# Altium schematic sheet Peripheral_Section.SchDoc
size A4; DocumentNumber: 6; SheetNumber: 6; SheetTotal: 7
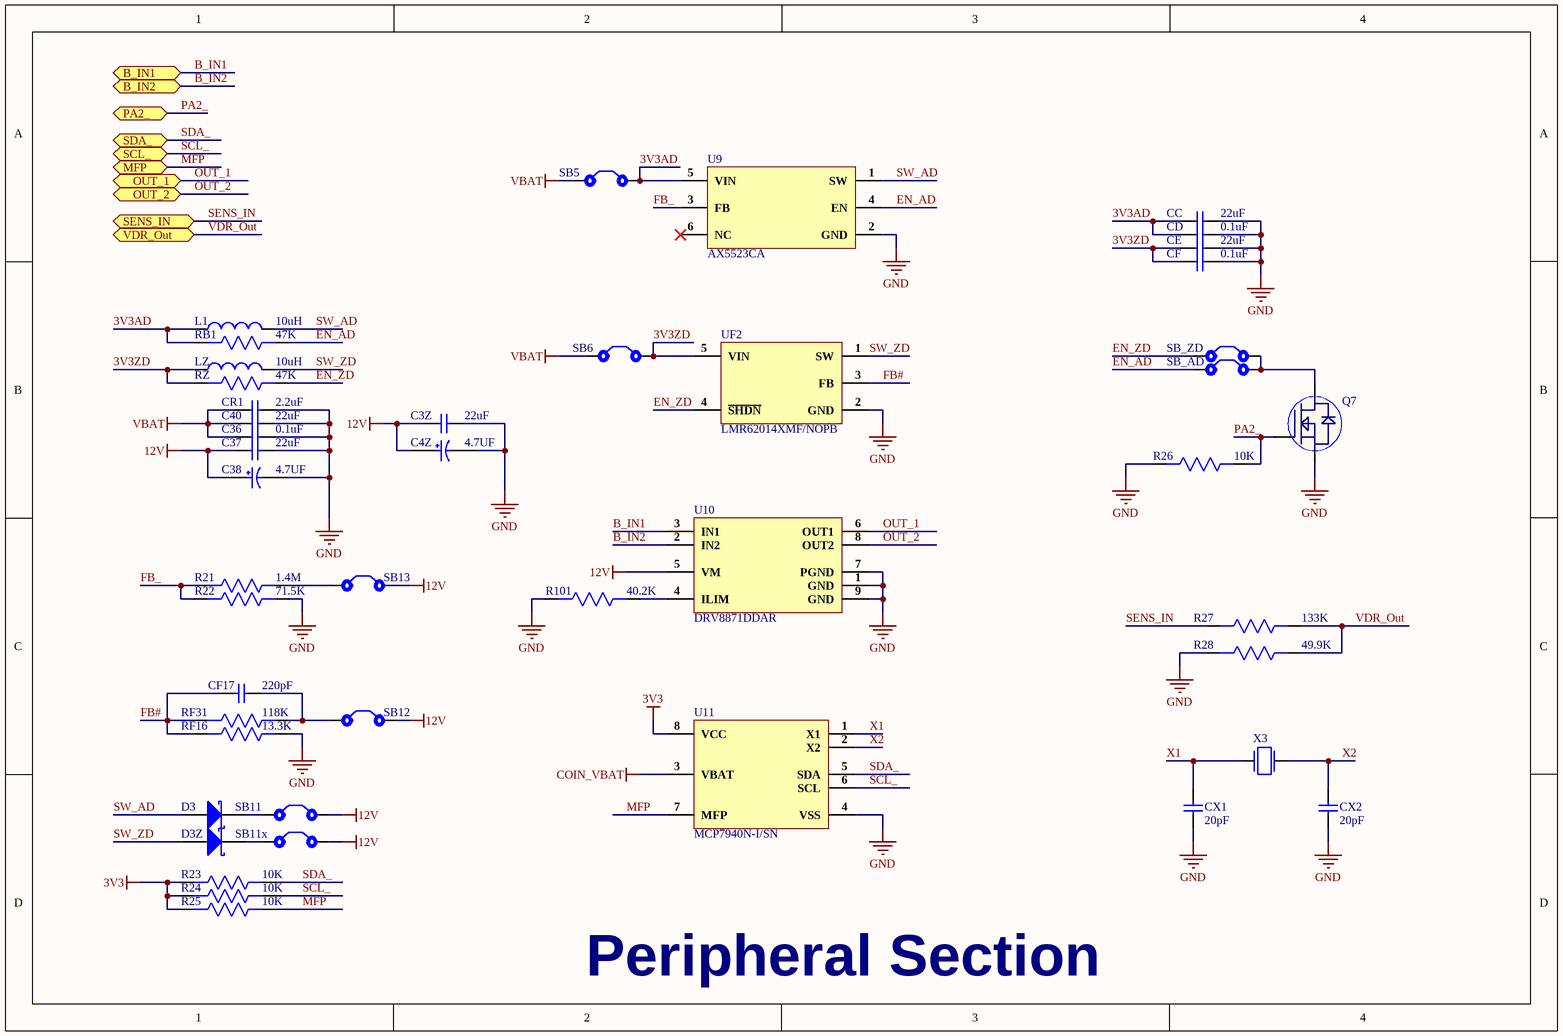
[diagram p0: Peripheral_Section.SchDoc]

## Parts
C3Z  22uF  [Cap0805]
C4Z  4.7UF  [TAJB475K035RNJ]
C36  0.1uF  [Cap0402]
C37  22uF  [Cap0805]
C38  4.7UF  [TAJB475K035RNJ]
C40  22uF  [Cap0805]
CC  22uF  [Cap0805]
CD  0.1uF  [Cap0402]
CE  22uF  [Cap0805]
CF  0.1uF  [Cap0402]
CF17  220pF  [Cap0402]
CR1  2.2uF  [Cap0402]
CX1  20pF  [Cap 0201]
CX2  20pF  [Cap 0201]
D3  PMEG3010ER,115  [SOD123W]  (value not drawn)
D3Z  PMEG3010ER,115  [SOD123W]  (value not drawn)
L1  value 10uH  [MS0420-100M]  (hidden comment: MS0420-100M)
LZ  value 10uH  [MS0420-100M]  (hidden comment: MS0420-100M)
Q7  ZVN3310FTA  [SOT23-3]  (value not drawn)
R21  1.4M  [Res0603]
R22  71.5K  [Res0402]
R23  10K  [Res0402]
R24  10K  [Res0402]
R25  10K  [Res0402]
R26  10K  [Res0402]
R27  133K  [Res0402]
R28  49.9K  [Res0402]
R101  40.2K  [Res0402]
RB1  47K  [Res0402]
RF16  13.3K  [Res0402]
RF31  118K  [Res0402]
RZ  47K  [Res0402]
SB5  Solder Bridge  [Solder Bridge]  (value not drawn)
SB6  Solder Bridge  [Solder Bridge]  (value not drawn)
SB11  Solder Bridge  [Solder Bridge]  (value not drawn)
SB11x  Solder Bridge  [Solder Bridge]  (value not drawn)
SB12  Solder Bridge  [Solder Bridge]  (value not drawn)
SB13  Solder Bridge  [Solder Bridge]  (value not drawn)
SB_AD  Solder Bridge  [Solder Bridge]  (value not drawn)
SB_ZD  Solder Bridge  [Solder Bridge]  (value not drawn)
U9  AX5523CA  [SOT-23-6]
U10  DRV8871DDAR  [DRV8871DDAR]
U11  MCP7940N-I/SN  [MCP7940N-I/SN]
UF2  LMR62014XMF/NOPB  [SOT23-5]
X3  NX3215SA-32.768K-STD-MUA-8  [2-SMD, No Lead]  (value not drawn)

## Ports
B_IN1 (bidir), B_IN2 (bidir), MFP (bidir), OUT_1 (bidir), OUT_2 (bidir), PA2_ (bidir), SCL_ (bidir), SDA_ (bidir), SENS_IN (bidir), VDR_Out (bidir)

## Nets
3V3: R23.2 R24.2 R25.2 U11.8(VCC)
12V: C3Z.1 C4Z.2 C37.1 C38.2 SB11.2 SB11x.2 SB12.2 SB13.2 U10.5(VM)
COIN_VBAT: U11.3(VBAT)
GND: C3Z.2 C4Z.1 C36.2 C37.2 C38.1 C40.2 CC.2 CD.2 CE.2 CF.2 CR1.2 CX1.1 CX2.1 Q7.2(S) R22.1 R26.2 R28.2 R101.2 RF16.1 U9.2(GND) U10.1(GND) U10.7(PGND) U10.9(GND) U11.4(VSS) UF2.2(GND)
VBAT: C36.1 C40.1 CR1.1 SB5.1 SB6.1
3V3AD: CC.1 CD.1 L1.1 RB1.2 SB5.2 U9.5(VIN)
3V3ZD: CE.1 CF.1 LZ.1 RZ.2 SB6.2 UF2.5(VIN)
B_IN1: U10.3(IN1) ; port B_IN1
B_IN2: U10.2(IN2) ; port B_IN2
EN_AD: RB1.1 SB_AD.1 U9.4(EN)
EN_ZD: RZ.1 SB_ZD.1 UF2.4(~{SHDN})
FB#: CF17.1 RF16.2 RF31.2 UF2.3(FB)
FB_: R21.2 R22.2 U9.3(FB)
MFP: R25.1 U11.7(MFP) ; port MFP
OUT_1: U10.6(OUT1) ; port OUT_1
OUT_2: U10.8(OUT2) ; port OUT_2
PA2_: Q7.1(G) R26.1 ; port PA2_
SCL_: R24.1 U11.6(SCL) ; port SCL_
SDA_: R23.1 U11.5(SDA) ; port SDA_
SENS_IN: R27.2 ; port SENS_IN
SW_AD: D3.A L1.2 U9.1(SW)
SW_ZD: D3Z.A LZ.2 UF2.1(SW)
VDR_Out: R27.1 R28.1 ; port VDR_Out
X1: CX1.2 U11.1(X1) X3.2
X2: CX2.2 U11.2(X2) X3.1
NetCF17_2: CF17.2 RF31.1 SB12.1
NetD3_K: D3.K SB11.1
NetD3Z_K: D3Z.K SB11x.1
NetQ7_3: Q7.3(D) SB_AD.2 SB_ZD.2
NetR21_1: R21.1 SB13.1
NetR101_1: R101.1 U10.4(ILIM)

Not connected (* = marked no-connect by the designer): U9 6(NC)*

## Notes on the sheet
- Peripheral Section

## Library data of the parts
C3Z C37 C40 = GRM21BR61E226ME44L: CAP CER 22UF 25V X5R 0805; Manufacturer: Murata; Material: Ceramic; Tolerance: 20%; Supplier 1: Digi-Key; Manufacturer Part Number: GRM21BR61E226ME44L; Stock 1: 469852; Pricing 1: 1=0.54, 10=0.383, 100=0.2521, 500=0.18672, 1000=0.15871 (USD); Mount: Surface Mount; Case/Package: 0805; Weight: 0.000335oz; Case Code (Metric): 2012; Case Code (Imperial): 0805; Min Operating Temperature: -55°C; Max Operating Temperature: 85°C; Capacitance: 22uF; Voltage Rating: 25V; Packaging: Tape and Reel; Dielectric: X5R; Voltage: 25V; Termination: SMD/SMT; Composition: Ceramic; Voltage Rating (DC): 25V; Package Quantity: 3000; Length: 2mm; Height: 1.25mm; Width: 1.25mm; Thickness: 0.057inch; Depth: 1.25mm; REACH SVHC: No SVHC; Lead Free: Lead Free; ComponentLink1URL: http://www.farnell.com/datasheets/2048737.pdf?src-supplier=Farnell; ComponentLink1Description: http://www.farnell.com/datasheets/2048737.pdf?src-supplier=Farnell; ComponentLink2URL: http://www.farnell.com/datasheets/2048737.pdf?src-supplier=Element14; ComponentLink2Description: http://www.farnell.com/datasheets/2048737.pdf?src-supplier=Element14; Supplier Part Number 1: 490-10749-1-ND
C4Z C38 = TAJB475K035RNJ: CAP TANT 4.7UF 10% 35V 1411; Manufacturer: Kyocera AVX; Dielectric Material: Tantalum; Tolerance: 20%; ESR (Equivalent Series Resistance): 3.1R; Leakage Current: 1.6uA; Polarity: Polar; Dissipation Factor: 6%; Supplier 1: Digi-Key; Manufacturer Part Number: TAJB475K035RNJ; Stock 1: 3949; Pricing 1: 1=0.71, 10=0.505, 100=0.3322, 500=0.2461, 1000=0.20919 (USD); Mount: Surface Mount,PCB; Case/Package: 1210; Number of Pins: 2; Weight: 0.000564oz; Case Code (Imperial): 1210; Case Code (Metric): 3528; Min Operating Temperature: -55°C; Max Operating Temperature: 125°C; Capacitance: 4.7uF; Voltage Rating: 35V; Packaging: Tape and Reel; Package Quantity: 1; Voltage Rating (DC): 35V; Termination: SMD/SMT; Voltage: 35V; Features: General Purpose; Length: 3.5mm; Height: 1.9mm; Depth: 2.8mm; Width: 2.8mm; Height - Seated (Max): 0.083inch; Radiation Hardening: No; REACH SVHC: No SVHC; Lead Free: Lead Free; ComponentLink1URL: http://uk.rs-online.com/webdocs/0ccd/0900766b80ccdc61.pdf?src-supplier=RSComponents; ComponentLink1Description: http://uk.rs-online.com/webdocs/0ccd/0900766b80ccdc61.pdf?src-supplier=RSComponents; ComponentLink2URL: http://www.farnell.com/datasheets/1826076.pdf?src-supplier=Element14; ComponentLink2Description: http://www.farnell.com/datasheets/1826076.pdf?src-supplier=Element14; ComponentLink3URL: http://datasheets.avx.com/TAJ.pdf?src-supplier=Digi-Key; ComponentLink3Description: http://datasheets.avx.com/TAJ.pdf?src-supplier=Digi-Key; ComponentLink4URL: http://www.avx.com/docs/Catalogs/taj.pdf?src-supplier=Farnell; ComponentLink4Description: http://www.avx.com/docs/Catalogs/taj.pdf?src-supplier=Farnell; ComponentLink5URL: https://www.alliedelec.com/m/d/9166fb755e7ffffad4c533f86d810ce4.pdf?src-supplier=Allied+Electronics; ComponentLink5Description: https://www.alliedelec.com/m/d/9166fb755e7ffffad4c533f86d810ce4.pdf?src-supplier=Allied+Electronics; ComponentLink6URL: https://www.distrelec.biz/Web/Downloads/_e/ng/taj_ENG.pdf?mime=application%2Fpdf&src-supplier=Distrelec; ComponentLink6Description: https://www.distrelec.biz/Web/Downloads/_e/ng/taj_ENG.pdf?mime=application%2Fpdf&src-supplier=Distrelec; ComponentLink7URL: http://www.avx.com/docs/catalogs/taj.pdf?src-supplier=Avnet+Europe; ComponentLink7Description: http://www.avx.com/docs/catalogs/taj.pdf?src-supplier=Avnet+Europe; ComponentLink8URL: http://www.avx.com/docs/catalogs/taj.pdf?src-supplier=Avnet; ComponentLink8Description: http://www.avx.com/docs/catalogs/taj.pdf?src-supplier=Avnet; ComponentLink9URL: http://www.avxcorp.com/docs/Catalogs/taj.pdf?src-supplier=Future+Electronics; ComponentLink9Description: http://www.avxcorp.com/docs/Catalogs/taj.pdf?src-supplier=Future+Electronics; ComponentLink10URL: http://www.mouser.com/ds/2/40/taj-776811.pdf?src-supplier=Mouser; ComponentLink10Description: http://www.mouser.com/ds/2/40/taj-776811.pdf?src-supplier=Mouser; ComponentLink11URL: https://www.verical.com/server-webapp/html/getDatasheet?partID=149140&src-supplier=Verical; ComponentLink11Description: https://www.verical.com/server-webapp/html/getDatasheet?partID=149140&src-supplier=Verical; Supplier Part Number 1: 478-1691-1-ND
C36 CD CF = CC0402KRX7R7BB104: CAP CER 0.1UF 16V X7R 0402; Manufacturer: Yageo; Tolerance: 10%; Capacitance: 100nF; Supplier 1: Digi-Key; Manufacturer Part Number: CC0402KRX7R7BB104; Stock 1: 16982736; Pricing 1: 1=0.1, 10=0.034, 100=0.015, 500=0.0107, 1000=0.00841, 2500=0.00764, 5000=0.00703 (USD); Mount: Surface Mount; Case/Package: 0402; Number of Pins: 2; Case Code (Metric): 1005; Case Code (Imperial): 0402; Min Operating Temperature: -55°C; Max Operating Temperature: 125°C; Dielectric: X7R; Voltage Rating: 16V; Voltage Rating (DC): 16V; Packaging: Tape and Reel; Package Quantity: 1; Termination: SMD/SMT; Composition: Ceramic; Voltage: 16V; Length: 1mm; Height: 0.5mm; Width: 0.02inch; Thickness: 0.022inch; Depth: 0.5mm; Radiation Hardening: No; REACH SVHC: No SVHC; Lead Free: Lead Free; Halogen Free: Halogen Free; ComponentLink1URL: http://www.yageo.com/documents/recent/UPY-GPHC_X7R_6.3V-to-50V_8.pdf?src-supplier=Avnet+Europe; ComponentLink1Description: http://www.yageo.com/documents/recent/UPY-GPHC_X7R_6.3V-to-50V_8.pdf?src-supplier=Avnet+Europe; ComponentLink2URL: http://www.yageo.com/documents/recent/UPY-GPHC_X7R_6.3V-to-50V_18.pdf?src-supplier=Digi-Key; ComponentLink2Description: http://www.yageo.com/documents/recent/UPY-GPHC_X7R_6.3V-to-50V_18.pdf?src-supplier=Digi-Key; ComponentLink3URL: http://www.yageo.com/documents/recent/UPY-GPHC_X7R_6.3V-to-50V_8.pdf?src-supplier=Avnet; ComponentLink3Description: http://www.yageo.com/documents/recent/UPY-GPHC_X7R_6.3V-to-50V_8.pdf?src-supplier=Avnet; ComponentLink4URL: http://www.yageo.com/documents/recent/UPY-GPHC_X7R_6.3V-to-50V_18.pdf?src-supplier=Mouser; ComponentLink4Description: http://www.yageo.com/documents/recent/UPY-GPHC_X7R_6.3V-to-50V_18.pdf?src-supplier=Mouser; ComponentLink5URL: http://www.farnell.com/datasheets/2167236.pdf?src-supplier=Element14; ComponentLink5Description: http://www.farnell.com/datasheets/2167236.pdf?src-supplier=Element14; ComponentLink6URL: http://www.farnell.com/datasheets/1489800.pdf?src-supplier=Element14; ComponentLink6Description: http://www.farnell.com/datasheets/1489800.pdf?src-supplier=Element14; Supplier Part Number 1: 311-1338-1-ND
CC CE = GRM21BR61E226ME44L: CAP CER 22UF 25V X5R 0805; Manufacturer: Murata; Tolerance: 20%; Supplier 1: Digi-Key; Manufacturer Part Number: GRM21BR61E226ME44L; Stock 1: 469852; Pricing 1: 1=0.54, 10=0.383, 100=0.2521, 500=0.18672, 1000=0.15871 (USD); Mount: Surface Mount; Case/Package: 0805; Weight: 0.000335oz; Case Code (Metric): 2012; Case Code (Imperial): 0805; Material: Ceramic; Min Operating Temperature: -55°C; Max Operating Temperature: 85°C; Capacitance: 22uF; Voltage Rating: 25V; Packaging: Tape and Reel; Dielectric: X5R; Voltage: 25V; Termination: SMD/SMT; Composition: Ceramic; Voltage Rating (DC): 25V; Package Quantity: 3000; Length: 2mm; Height: 1.25mm; Width: 1.25mm; Thickness: 0.057inch; Depth: 1.25mm; REACH SVHC: No SVHC; Lead Free: Lead Free; ComponentLink1URL: http://www.farnell.com/datasheets/2048737.pdf?src-supplier=Farnell; ComponentLink1Description: http://www.farnell.com/datasheets/2048737.pdf?src-supplier=Farnell; ComponentLink2URL: http://www.farnell.com/datasheets/2048737.pdf?src-supplier=Element14; ComponentLink2Description: http://www.farnell.com/datasheets/2048737.pdf?src-supplier=Element14; Supplier Part Number 1: 490-10749-1-ND
CF17 = CC0402JRNPO9BN221: CAP CER 220PF 50V C0G/NPO 0402; Manufacturer: Yageo; Dielectric Material: Ceramic; Tolerance: 10%; Dielectric: C0G; Temperature Coefficient: 30ppm/°C; Insulation Resistance: 10GR; Dissipation Factor: 0.1%; Supplier 1: Digi-Key; Manufacturer Part Number: CC0402JRNPO9BN221; Stock 1: 97268; Pricing 1: 1=0.1, 10=0.039, 100=0.0172, 500=0.01228, 1000=0.00965, 2500=0.00877, 5000=0.00807 (USD); Mount: Surface Mount; Case/Package: 0402; Number of Pins: 2; Case Code (Metric): 1005; Case Code (Imperial): 0402; Min Operating Temperature: -55°C; Max Operating Temperature: 125°C; Capacitance: 220pF; Package Quantity: 1; Voltage Rating: 50V; Packaging: Tape and Reel; Termination: SMD/SMT; Voltage: 50V; Length: 1mm; Height: 0.5mm; Width: 0.02inch; Thickness: 0.022inch; Depth: 0.5mm; Radiation Hardening: No; REACH SVHC: No SVHC; Lead Free: Lead Free; ComponentLink1URL: http://www.yageo.com/documents/recent/UPY-GP_NP0_16V-to-50V_16.pdf?src-supplier=Digi-Key; ComponentLink1Description: http://www.yageo.com/documents/recent/UPY-GP_NP0_16V-to-50V_16.pdf?src-supplier=Digi-Key; ComponentLink2URL: http://www.yageo.com/documents/recent/UPY-GP_NP0_16V-to-50V_8.pdf?src-supplier=Avnet+Europe; ComponentLink2Description: http://www.yageo.com/documents/recent/UPY-GP_NP0_16V-to-50V_8.pdf?src-supplier=Avnet+Europe; ComponentLink3URL: http://www.farnell.com/datasheets/1132289.pdf?src-supplier=Element14; ComponentLink3Description: http://www.farnell.com/datasheets/1132289.pdf?src-supplier=Element14; ComponentLink4URL: http://www.farnell.com/datasheets/2213336.pdf?src-supplier=Element14; ComponentLink4Description: http://www.farnell.com/datasheets/2213336.pdf?src-supplier=Element14; Supplier Part Number 1: 311-1416-1-ND
CR1 = EMK105ABJ225KV-F: CAP CER 2.2UF 16V X5R 0402; Manufacturer: Taiyo Yuden; Tolerance: 10%; Supplier 1: Digi-Key; Manufacturer Part Number: EMK105ABJ225KV-F; Stock 1: 755; Pricing 1: 1=0.2, 10=0.139, 100=0.0706, 500=0.04834, 1000=0.04276, 2500=0.0409, 5000=0.03718 (USD); Mount: Surface Mount; Case/Package: 0402; Case Code (Imperial): 0402; Case Code (Metric): 1005; Min Operating Temperature: -55°C; Max Operating Temperature: 85°C; Packaging: Tape and Reel; Capacitance: 2.2uF; Voltage Rating: 16V; Lead Free: Lead Free; ComponentLink1URL: http://ds.yuden.co.jp/TYCOMPAS/ut/detail.do?productNo=EMK105ABJ225KV-F&amp;fileName=EMK105ABJ225KV-F_SS&amp;mode=specSheetDownload&src-supplier=Digi-Key; ComponentLink1Description: http://ds.yuden.co.jp/TYCOMPAS/ut/detail.do?productNo=EMK105ABJ225KV-F&amp;fileName=EMK105ABJ225KV-F_SS&amp;mode=specSheetDownload&src-supplier=Digi-Key; ComponentLink2URL: https://ds.yuden.co.jp/TYCOMPAS/ut/detail?pn=EMK105ABJ225KV-F &amp;u=M&src-supplier=Digi-Key; ComponentLink2Description: https://ds.yuden.co.jp/TYCOMPAS/ut/detail?pn=EMK105ABJ225KV-F &amp;u=M&src-supplier=Digi-Key; Supplier Part Number 1: 587-6002-1-ND
CX1 CX2 = GJM0336C1E200JB01D: CAP CER 20PF 25V C0H 0201; Manufacturer: Murata; Tolerance: 5%; Supplier 1: Digi-Key; Manufacturer Part Number: GJM0336C1E200JB01D; Stock 1: 13650; Pricing 1: 1=0.1, 10=0.074, 100=0.0329, 500=0.02348, 1000=0.01845, 2500=0.01678, 5000=0.01543 (USD); Mount: Surface Mount; Case/Package: 0201; Case Code (Metric): 0603; Case Code (Imperial): 0201; Min Operating Temperature: -55°C; Max Operating Temperature: 125°C; Capacitance: 20pF; Voltage Rating: 25V; Packaging: Tape and Reel; Termination: SMD/SMT; Voltage Rating (DC): 25V; Length: 0.024inch; Width: 0.012inch; Thickness: 0.013inch; Lead Free: Lead Free; ComponentLink1URL: http://www.mouser.com/ds/2/281/c02e-2905.pdf?src-supplier=Mouser; ComponentLink1Description: http://www.mouser.com/ds/2/281/c02e-2905.pdf?src-supplier=Mouser; ComponentLink2URL: http://search.murata.co.jp/Ceramy/image/img/A01X/partnumbering_e_01.pdf?src-supplier=Digi-Key; ComponentLink2Description: http://search.murata.co.jp/Ceramy/image/img/A01X/partnumbering_e_01.pdf?src-supplier=Digi-Key; Supplier Part Number 1: 490-13313-1-ND
D3 D3Z = PMEG3010ER,115: DIODE SCHOTTKY 30V 1A SOD123W; Manufacturer: Nexperia; Supplier 1: Digi-Key; Manufacturer Part Number: PMEG3010ER,115; Stock 1: 75070; Pricing 1: 1=0.36, 10=0.29, 100=0.1669, 500=0.1545, 1000=0.10506 (USD); Supplier Part Number 1: 1727-5201-1-ND
L1 LZ = MS0420-100M: 10uH ±20% 1.6A 230mΩ SMD,4.75x4.2x2mm Inductors (SMD) RoHS; Manufacturer: COILMX; Manufacturer Part No: MS0420-100M; Package: Custom
Q7 = ZVN3310FTA: MOSFET N-CH 100V .1A SOT23-3; Manufacturer: Diodes Zetex; Rise Time: 5ns; Continuous Drain Current (ID): 100mA; Gate to Source Voltage (Vgs): 20V; Turn-Off Delay Time: 4ns; Turn-On Delay Time: 3ns; Rds On Max: 10R; Input Capacitance: 40pF; Nominal Vgs: 2.4V; Max Power Dissipation: 330mW; Number of Elements: 1; Element Configuration: Single; Supplier 1: Digi-Key; Manufacturer Part Number: ZVN3310FTA; Stock 1: 16974; Pricing 1: 1=0.59, 10=0.517, 25=0.4852, 100=0.3522, 250=0.33972, 500=0.29432, 1000=0.25048 (USD); Mount: Surface Mount; Case/Package: SOT-23; Number of Pins: 3; Weight: 0.000282oz; Min Operating Temperature: -55°C; Max Operating Temperature: 150°C; Package Quantity: 3000; Packaging: Tape and Reel; Dual Supply Voltage: 100V; Drain to Source Voltage (Vdss): 100V; Number of Channels: 1; Drain to Source Breakdown Voltage: 100V; Drain to Source Resistance: 10R; Fall Time: 5ns; On-State Resistance: 10R; Power Dissipation: 330mW; Termination: SMD/SMT; Threshold Voltage: 2.4V; Voltage Rating (DC): 100V; Current Rating: 100mA; Current: 100mA; Voltage: 100V; Length: 3.04mm; Height: 1.02mm; Width: 1.4mm; Radiation Hardening: No; REACH SVHC: No SVHC; Lead Free: Lead Free; ComponentLink1URL: http://www.diodes.com/_files/datasheets/ZVN3310F.pdf?src-supplier=Digi-Key; ComponentLink1Description: http://www.diodes.com/_files/datasheets/ZVN3310F.pdf?src-supplier=Digi-Key; Supplier Part Number 1: ZVN3310FCT-ND
R21 = AC0603FR-071M4L: Thick Film Resistors - SMD; Manufacturer: Yageo; Supplier 1: Mouser; Manufacturer Part Number: AC0603FR-071M4L; Stock 1: 0; Pricing 1: 1=0.1, 10=0.021, 100=0.007, 1000=0.005, 2500=0.003, 10000=0.003 (USD); Supplier Part Number 1: 603-AC0603FR-071M4L
R22 = AC0402FR-0771K5L: RES SMD 71.5K OHM 1% 1/16W 0402; Manufacturer: Yageo; Resistance: 71.5kR; Max Power Dissipation: 63mW; Temperature Coefficient: 100ppm/°C; Supplier 1: Digi-Key; Manufacturer Part Number: AC0402FR-0771K5L; Stock 1: 0; Pricing 1: 10000=0.0022 (USD); Case/Package: 0402; Min Operating Temperature: -55°C; Max Operating Temperature: 155°C; Packaging: Tape and Reel; Composition: Thick Film; Number of Terminations: 2; Tolerance: 1%; Features: Moisture Resistant,Automotive AEC-Q200; Length: 0.039inch; Height: 0.015inch; Width: 0.02inch; ComponentLink1URL: http://www.yageo.com/NewPortal/yageodocoutput?fileName=/pdf/R-Chip/PYu-AC_51_RoHS_L_6.pdf&src-supplier=Digi-Key; ComponentLink1Description: http://www.yageo.com/NewPortal/yageodocoutput?fileName=/pdf/R-Chip/PYu-AC_51_RoHS_L_6.pdf&src-supplier=Digi-Key; Supplier Part Number 1: AC0402FR-0771K5L-ND
R23-R26 = RK73B1ETTP103J: RES 10K OHM 5% 1/10W 0402; Manufacturer: KOA Speer; Resistance: 10kR; Power Rating: 63mW; Voltage Rating: 50V; Temperature Coefficient: 200ppm/°C; Supplier 1: Digi-Key; Manufacturer Part Number: RK73B1ETTP103J; Stock 1: 2917894; Pricing 1: 1=0.1, 10=0.016, 100=0.0065, 1000=0.00292, 2500=0.00253, 5000=0.00209 (USD); Mount: Surface Mount; Case/Package: 0402; Case Code (Imperial): 0402; Case Code (Metric): 1005; Min Operating Temperature: -55°C; Max Operating Temperature: 155°C; Packaging: Tape and Reel; Tolerance: 5%; Package Quantity: 10000; Composition: Thick Film; Termination: SMD/SMT; Military Standard: Not; Voltage Rating (DC): 50V; Length: 1mm; Height: 0.35mm; Width: 0.5mm; Depth: 0.5mm; Lead Free: Lead Free; ComponentLink1URL: https://www.verical.com/server-webapp/html/getDatasheet?partID=89073&src-supplier=Verical; ComponentLink1Description: https://www.verical.com/server-webapp/html/getDatasheet?partID=89073&src-supplier=Verical; Supplier Part Number 1: 2019-RK73B1ETTP103JCT-ND
R27 = RC0402FR-07133KL: RES SMD 133K OHM 1% 1/16W 0402; Manufacturer: Yageo; Resistance: 133kR; Power Rating: 62.5mW; Voltage Rating: 50V; Temperature Coefficient: 100ppm/°C; Max Power Dissipation: 63mW; ComponentLink1URL: http://www.yageo.com/documents/recent/PYu-RC_Group_51_RoHS_L_10.pdf?src-supplier=Digi-Key; ComponentLink1Description: http://www.yageo.com/documents/recent/PYu-RC_Group_51_RoHS_L_10.pdf?src-supplier=Digi-Key; ComponentLink2URL: http://www.yageo.com/documents/recent/PYu-RC_Group_51_RoHS_L_9.pdf?src-supplier=Digi-Key; ComponentLink2Description: http://www.yageo.com/documents/recent/PYu-RC_Group_51_RoHS_L_9.pdf?src-supplier=Digi-Key; ComponentLink3URL: http://www.mouser.com/catalog/specsheets/RC0603.pdf?src-supplier=Mouser; ComponentLink3Description: http://www.mouser.com/catalog/specsheets/RC0603.pdf?src-supplier=Mouser; Supplier 1: Digi-Key; Manufacturer Part Number: RC0402FR-07133KL; Stock 1: 328; Pricing 1: 1=0.1, 10=0.016, 100=0.0064, 1000=0.0029, 2500=0.0025, 5000=0.0021 (USD); Case/Package: 0402; Weight: 2.3E-05oz; Case Code (Imperial): 0402; Case Code (Metric): 1005; Contact Plating: Tin,Matte; Min Operating Temperature: -55°C; Max Operating Temperature: 155°C; Tolerance: 1%; Packaging: Tape and Reel; Composition: Thick Film; Termination: SMD/SMT; Number of Terminations: 2; Military Standard: Not; Voltage Rating (DC): 50V; Working Voltage: 50V; Features: Moisture Resistant; Length: 1mm; Height: 0.016inch; Width: 0.5mm; Depth: 0.5mm; Lead Free: Lead Free; ComponentLink4URL: http://www.yageo.com/documents/recent/PYu-RC_Group_51_RoHS_L_8.pdf?src-supplier=Future+Electronics; ComponentLink4Description: http://www.yageo.com/documents/recent/PYu-RC_Group_51_RoHS_L_8.pdf?src-supplier=Future+Electronics; ComponentLink5URL: http://www.yageo.com/documents/recent/PYu-RC0402_51_RoHS_L_6.pdf?src-supplier=Avnet; ComponentLink5Description: http://www.yageo.com/documents/recent/PYu-RC0402_51_RoHS_L_6.pdf?src-supplier=Avnet; Supplier Part Number 1: YAG2970CT-ND
R28 = RK73H1ETTP4992F: RES 49.9K OHM 1% 1/10W 0402; Manufacturer: KOA Speer; Resistance: 49.9kR; Power Rating: 63mW; Voltage Rating: 50V; Temperature Coefficient: 100ppm/°C; Supplier 1: Digi-Key; Manufacturer Part Number: RK73H1ETTP4992F; Stock 1: 158829; Pricing 1: 1=0.1, 10=0.024, 100=0.0097, 1000=0.00437, 2500=0.0038, 5000=0.00314 (USD); Case/Package: 0402; Case Code (Imperial): 0402; Case Code (Metric): 1005; Min Operating Temperature: -55°C; Max Operating Temperature: 155°C; Tolerance: 1%; Packaging: Tape and Reel; Package Quantity: 10000; Composition: Thick Film; Termination: SMD/SMT; Working Voltage: 50V; Military Standard: Not; Voltage Rating (DC): 50V; Length: 1mm; Height: 0.35mm; Width: 0.5mm; Depth: 0.5mm; Lead Free: Lead Free; ComponentLink1URL: http://www.jameco.com/Jameco/Products/ProdDS/1883861.pdf?src-supplier=Jameco; ComponentLink1Description: http://www.jameco.com/Jameco/Products/ProdDS/1883861.pdf?src-supplier=Jameco; ComponentLink2URL: http://components.arrow.com/part/dataview/39721535S7077293N5146?src-supplier=Arrow; ComponentLink2Description: http://components.arrow.com/part/dataview/39721535S7077293N5146?src-supplier=Arrow; ComponentLink3URL: http://www.koaspeer.com/catimages/Products/RK73H/RK73H.pdf?src-supplier=Mouser; ComponentLink3Description: http://www.koaspeer.com/catimages/Products/RK73H/RK73H.pdf?src-supplier=Mouser; Supplier Part Number 1: 2019-RK73H1ETTP4992FCT-ND
R101 = RTT024022FTH: 40.2K ±1% 1/16W ±100ppm/°C 0402 Chip Resistor - Surface Mount RoHS; Manufacturer: RALEC; Manufacturer Part No: RTT024022FTH; Package: 0402; Value: 40.2K
RB1 RZ = RC0402FR-0747KL: RES SMD 47K OHM 1% 1/16W 0402; Manufacturer: Yageo; Power Rating: 62.5mW; Temperature Coefficient: 100ppm/°C; Voltage Rating: 50V; Resistance: 47kR; Max Power Dissipation: 63mW; Supplier 1: Digi-Key; Manufacturer Part Number: RC0402FR-0747KL; Stock 1: 0; Pricing 1: 1=0.1, 10=0.016, 100=0.0064, 1000=0.00289, 2500=0.00251, 5000=0.00207 (USD); Case/Package: 0402; Case Code (Imperial): 0402; Case Code (Metric): 1005; Min Operating Temperature: -55°C; Max Operating Temperature: 155°C; Tolerance: 1%; Packaging: Tape and Reel; Package Quantity: 1; Termination: SMD/SMT; Composition: Thick Film; Number of Terminations: 2; Military Standard: Not; Features: Moisture Resistant; Length: 1mm; Height: 0.016inch; Depth: 0.5mm; Width: 0.5mm; REACH SVHC: Unknown; Lead Free: Lead Free; ComponentLink1URL: http://www.yageo.com/documents/recent/PYu-RC0402_51_RoHS_L_6_r.pdf?src-supplier=Future+Electronics; ComponentLink1Description: http://www.yageo.com/documents/recent/PYu-RC0402_51_RoHS_L_6_r.pdf?src-supplier=Future+Electronics; ComponentLink2URL: http://www.farnell.com/datasheets/1018594.pdf?src-supplier=Element14; ComponentLink2Description: http://www.farnell.com/datasheets/1018594.pdf?src-supplier=Element14; ComponentLink3URL: https://www.verical.com/server-webapp/html/getDatasheet?partID=323748&src-supplier=Verical; ComponentLink3Description: https://www.verical.com/server-webapp/html/getDatasheet?partID=323748&src-supplier=Verical; ComponentLink4URL: http://www.yageo.com/documents/recent/PYu-RC_Group_51_RoHS_L_10.pdf?src-supplier=Digi-Key; ComponentLink4Description: http://www.yageo.com/documents/recent/PYu-RC_Group_51_RoHS_L_10.pdf?src-supplier=Digi-Key; Supplier Part Number 1: 311-47.0KLRDKR-ND
RF16 = RC0402FR-0713K3L: RES SMD 13.3K OHM 1% 1/16W 0402; Manufacturer: Yageo; Resistance: 13.3kR; Temperature Coefficient: 100ppm/°C; Power Rating: 62.5mW; Voltage Rating: 50V; Max Power Dissipation: 63mW; Supplier 1: Digi-Key; Manufacturer Part Number: RC0402FR-0713K3L; Stock 1: 459115; Pricing 1: 1=0.1, 10=0.016, 100=0.0064, 1000=0.00289, 2500=0.00251, 5000=0.00207 (USD); Case/Package: 0402; Contact Plating: Tin,Matte; Case Code (Imperial): 0402; Case Code (Metric): 1005; Min Operating Temperature: -55°C; Max Operating Temperature: 155°C; Tolerance: 1%; Composition: Thick Film; Packaging: Tape and Reel; Number of Terminations: 2; Termination: SMD/SMT; Military Standard: Not; Voltage Rating (DC): 50V; Working Voltage: 50V; Features: Moisture Resistant; Length: 1mm; Height: 0.016inch; Width: 0.02inch; Depth: 0.5mm; Lead Free: Lead Free; ComponentLink1URL: http://www.yageo.com/documents/recent/PYu-RC0402_51_RoHS_L_6.pdf?src-supplier=Avnet+Europe; ComponentLink1Description: http://www.yageo.com/documents/recent/PYu-RC0402_51_RoHS_L_6.pdf?src-supplier=Avnet+Europe; ComponentLink2URL: http://www.yageo.com/documents/recent/PYu-RC0402_51_RoHS_L_6_r.pdf?src-supplier=Future+Electronics; ComponentLink2Description: http://www.yageo.com/documents/recent/PYu-RC0402_51_RoHS_L_6_r.pdf?src-supplier=Future+Electronics; ComponentLink3URL: http://www.mouser.com/ds/2/447/PYu-RC0402_51_RoHS_L_6_r-8721.pdf?src-supplier=Mouser; ComponentLink3Description: http://www.mouser.com/ds/2/447/PYu-RC0402_51_RoHS_L_6_r-8721.pdf?src-supplier=Mouser; Supplier Part Number 1: YAG2974CT-ND
RF31 = AC0402FR-07118KL: RES SMD 118K OHM 1% 1/16W 0402; Manufacturer: Yageo; Resistance: 118kR; Max Power Dissipation: 63mW; Temperature Coefficient: 100ppm/°C; Supplier 1: Digi-Key; Manufacturer Part Number: AC0402FR-07118KL; Stock 1: 0; Pricing 1: 10000=0.0022 (USD); Case/Package: 0402; Min Operating Temperature: -55°C; Max Operating Temperature: 155°C; Packaging: Tape and Reel; Composition: Thick Film; Number of Terminations: 2; Tolerance: 1%; Features: Moisture Resistant,Automotive AEC-Q200; Length: 0.039inch; Height: 0.015inch; Width: 0.02inch; ComponentLink1URL: http://www.yageo.com/NewPortal/yageodocoutput?fileName=/pdf/R-Chip/PYu-AC_51_RoHS_L_6.pdf&src-supplier=Digi-Key; ComponentLink1Description: http://www.yageo.com/NewPortal/yageodocoutput?fileName=/pdf/R-Chip/PYu-AC_51_RoHS_L_6.pdf&src-supplier=Digi-Key; Supplier Part Number 1: AC0402FR-07118KL-ND
SB5 SB6 SB11 SB11x SB12 SB13 SB_AD SB_ZD = Solder Bridge: Solder Bridge ON
U9 = AX5523CA: Step-Up Positive Adjustable 1 2A 1.2MHz SOT-23-6 DC-DC Converters RoHS; Manufacturer: Axelite Tech; Manufacturer Part No: AX5523CA; Package: SOT-23-6; Value: *
U10 = DRV8871DDAR: IC MOTOR DRVR UNIPLR 8SO PWRPAD; Manufacturer: Texas Instruments; Interface: PWM; Max Output Current: 3.6A; Fault Protection: Over Temperature; Supplier 1: Digi-Key; Manufacturer Part Number: DRV8871DDAR; Stock 1: 8562; Pricing 1: 1=2.51, 10=2.253, 25=2.1252, 100=1.7, 250=1.48752, 500=1.445, 1000=1.1475 (USD); Mount: Surface Mount; Min Operating Temperature: -40°C; Max Operating Temperature: 125°C; Packaging: Tape and Reel; Lead Free: Lead Free; ComponentLink1URL: http://www.ti.com/lit/pdf/slyb165?src-supplier=Digi-Key; ComponentLink1Description: http://www.ti.com/lit/pdf/slyb165?src-supplier=Digi-Key; ComponentLink2URL: http://www.ti.com/lit/ds/symlink/drv8871.pdf?src-supplier=Digi-Key; ComponentLink2Description: http://www.ti.com/lit/ds/symlink/drv8871.pdf?src-supplier=Digi-Key; Supplier Part Number 1: 296-43024-1-ND
U11 = MCP7940N-I/SN: IC RTC CLK/CALENDAR I2C 8-SOIC; Manufacturer: Microchip; Logic Function: Clock; Time Format: HH:MM:SS; Min Supply Voltage: 1.8V; Max Supply Voltage: 5.5V; Memory Size: 64B; Max Frequency: 400kHz; Supplier 1: Digi-Key; Manufacturer Part Number: MCP7940N-I/SN; Stock 1: 4875; Pricing 1: 1=0.74, 25=0.68, 100=0.65 (USD); Mount: Surface Mount; Case/Package: SOIC; Number of Pins: 8; Contact Plating: Tin,Matte; Min Operating Temperature: -40°C; Max Operating Temperature: 85°C; Interface: I2C; Packaging: Rail/Tube; Package Quantity: 100; Length: 4.9mm; Height: 1.5mm; Width: 3.9mm; Radiation Hardening: No; REACH SVHC: No SVHC; Lead Free: Lead Free; ComponentLink1URL: http://www.microchip.com/mymicrochip/filehandler.aspx?ddocname=en569228&src-supplier=Digi-Key; ComponentLink1Description: http://www.microchip.com/mymicrochip/filehandler.aspx?ddocname=en569228&src-supplier=Digi-Key; ComponentLink2URL: http://www.farnell.com/datasheets/2129560.pdf?src-supplier=Mouser; ComponentLink2Description: http://www.farnell.com/datasheets/2129560.pdf?src-supplier=Mouser; ComponentLink3URL: http://www.microchip.com/mymicrochip/filehandler.aspx?ddocname=en553487&src-supplier=Future+Electronics; ComponentLink3Description: http://www.microchip.com/mymicrochip/filehandler.aspx?ddocname=en553487&src-supplier=Future+Electronics; ComponentLink4URL: http://www.farnell.com/datasheets/2129560.pdf?src-supplier=Avnet+Europe; ComponentLink4Description: http://www.farnell.com/datasheets/2129560.pdf?src-supplier=Avnet+Europe; ComponentLink5URL: http://www.farnell.com/datasheets/2129560.pdf?src-supplier=Avnet; ComponentLink5Description: http://www.farnell.com/datasheets/2129560.pdf?src-supplier=Avnet; Supplier Part Number 1: MCP7940N-I/SN-ND
UF2 = LMR62014XMF/NOPB: IC REG BOOST ADJ 2A SOT23-5; Manufacturer: TI National Semiconductor; Max Output Current: 1.4A; Min Input Voltage: 2.7V; Max Input Voltage: 14V; Number of Outputs: 1; Output Voltage: 20V; Switching Frequency: 1.6MHz; Min Output Voltage: 3V; Synchronous Rectifier: No; Quiescent Current: 2mA; Output Type: Adjustable; Output Configuration: Positive; Supplier 1: Digi-Key; Manufacturer Part Number: LMR62014XMF/NOPB; Stock 1: 74950; Pricing 1: 1=1.6, 10=1.428, 25=1.3552, 100=1.0406, 250=0.9196, 500=0.8712 (USD); Mount: Surface Mount; Case/Package: SOT-23-5; Number of Pins: 5; Contact Plating: Tin,Matte; Min Operating Temperature: -40°C; Max Operating Temperature: 125°C; Output Current: 1.4A; Packaging: Tape and Reel; Package Quantity: 1000; Max Output Voltage: 20V; Topology: Boost; Radiation Hardening: No; REACH SVHC: No SVHC; Lead Free: Lead Free; ComponentLink1URL: http://www.ti.com/general/docs/lit/getliterature.tsp?genericPartNumber=LMR62014&&fileType=pdf&src-supplier=Avnet; ComponentLink1Description: http://www.ti.com/general/docs/lit/getliterature.tsp?genericPartNumber=LMR62014&&fileType=pdf&src-supplier=Avnet; ComponentLink2URL: http://www.ti.com/lit/gpn/lmr62014?src-supplier=Mouser; ComponentLink2Description: http://www.ti.com/lit/gpn/lmr62014?src-supplier=Mouser; ComponentLink3URL: http://www.farnell.com/datasheets/1882593.pdf?src-supplier=Element14; ComponentLink3Description: http://www.farnell.com/datasheets/1882593.pdf?src-supplier=Element14; ComponentLink4URL: http://www.ti.com/lit/ds/symlink/lmr62014.pdf?src-supplier=Digi-Key; ComponentLink4Description: http://www.ti.com/lit/ds/symlink/lmr62014.pdf?src-supplier=Digi-Key; Supplier Part Number 1: LMR62014XMF/NOPBCT-ND
X3 = NX3215SA-32.768K-STD-MUA-8: CRYSTAL 32.7680KHZ 12.5PF SMD; Manufacturer: NDK; Frequency: 32.768kHz; Frequency Tolerance: 20ppm; ESR (Equivalent Series Resistance): 70kR; Supplier 1: Digi-Key; Manufacturer Part Number: NX3215SA-32.768K-STD-MUA-8; Stock 1: 29951; Pricing 1: 1=0.68, 10=0.602, 50=0.5628, 100=0.4974, 500=0.47124, 1000=0.3927 (USD); Mount: Surface Mount; Case/Package: SMD/SMT; Number of Pins: 2; Min Operating Temperature: -40°C; Max Operating Temperature: 85°C; Package Quantity: 1000; Load Capacitance: 12.5pF; Packaging: Tape and Reel; Length: 0.126inch; Height: 0.035inch; Width: 0.059inch; Lead Free: Lead Free; ComponentLink1URL: https://media.digikey.com/pdf/Data%20Sheets/NDK%20PDFs/NX3215SA-32.768K-STD-MUA-8.pdf?src-supplier=Digi-Key; ComponentLink1Description: https://media.digikey.com/pdf/Data%20Sheets/NDK%20PDFs/NX3215SA-32.768K-STD-MUA-8.pdf?src-supplier=Digi-Key; ComponentLink2URL: http://www.ndk.com/images/products/catalog/c_NX3215SA-STD-MUA-14_e.pdf?src-supplier=Digi-Key; ComponentLink2Description: http://www.ndk.com/images/products/catalog/c_NX3215SA-STD-MUA-14_e.pdf?src-supplier=Digi-Key; Supplier Part Number 1: 644-1156-6-ND